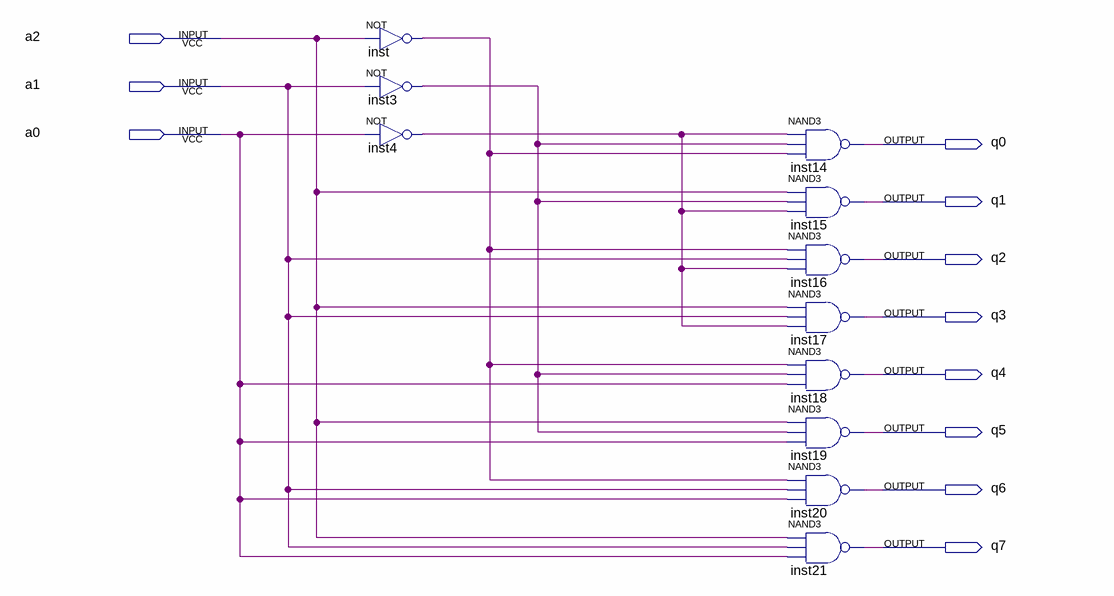
[diagram p0: schematic sheet]
// Quartus schematic decoder_3-8.bdf as structural Verilog: 11 symbols, 11 pins
module \decoder_3-8  (
  input  a2,
  input  a1,
  input  a0,
  output q0,
  output q1,
  output q2,
  output q3,
  output q4,
  output q5,
  output q6,
  output q7
);

  wire inst3_out, inst4_out, inst_out;

  not inst (inst_out, a2);
  not inst3 (inst3_out, a1);
  not inst4 (inst4_out, a0);
  nand inst14 (q0, inst4_out, inst3_out, inst_out);
  nand inst15 (q1, a2, inst3_out, inst4_out);
  nand inst16 (q2, inst_out, a1, inst4_out);
  nand inst17 (q3, a2, a1, inst4_out);
  nand inst18 (q4, inst_out, inst3_out, a0);
  nand inst19 (q5, a2, inst3_out, a0);
  nand inst20 (q6, inst_out, a1, a0);
  nand inst21 (q7, a2, a1, a0);
endmodule
